# Altium schematic sheet Sheet2.SchDoc
size A4; SheetNumber: 1; SheetTotal: 1
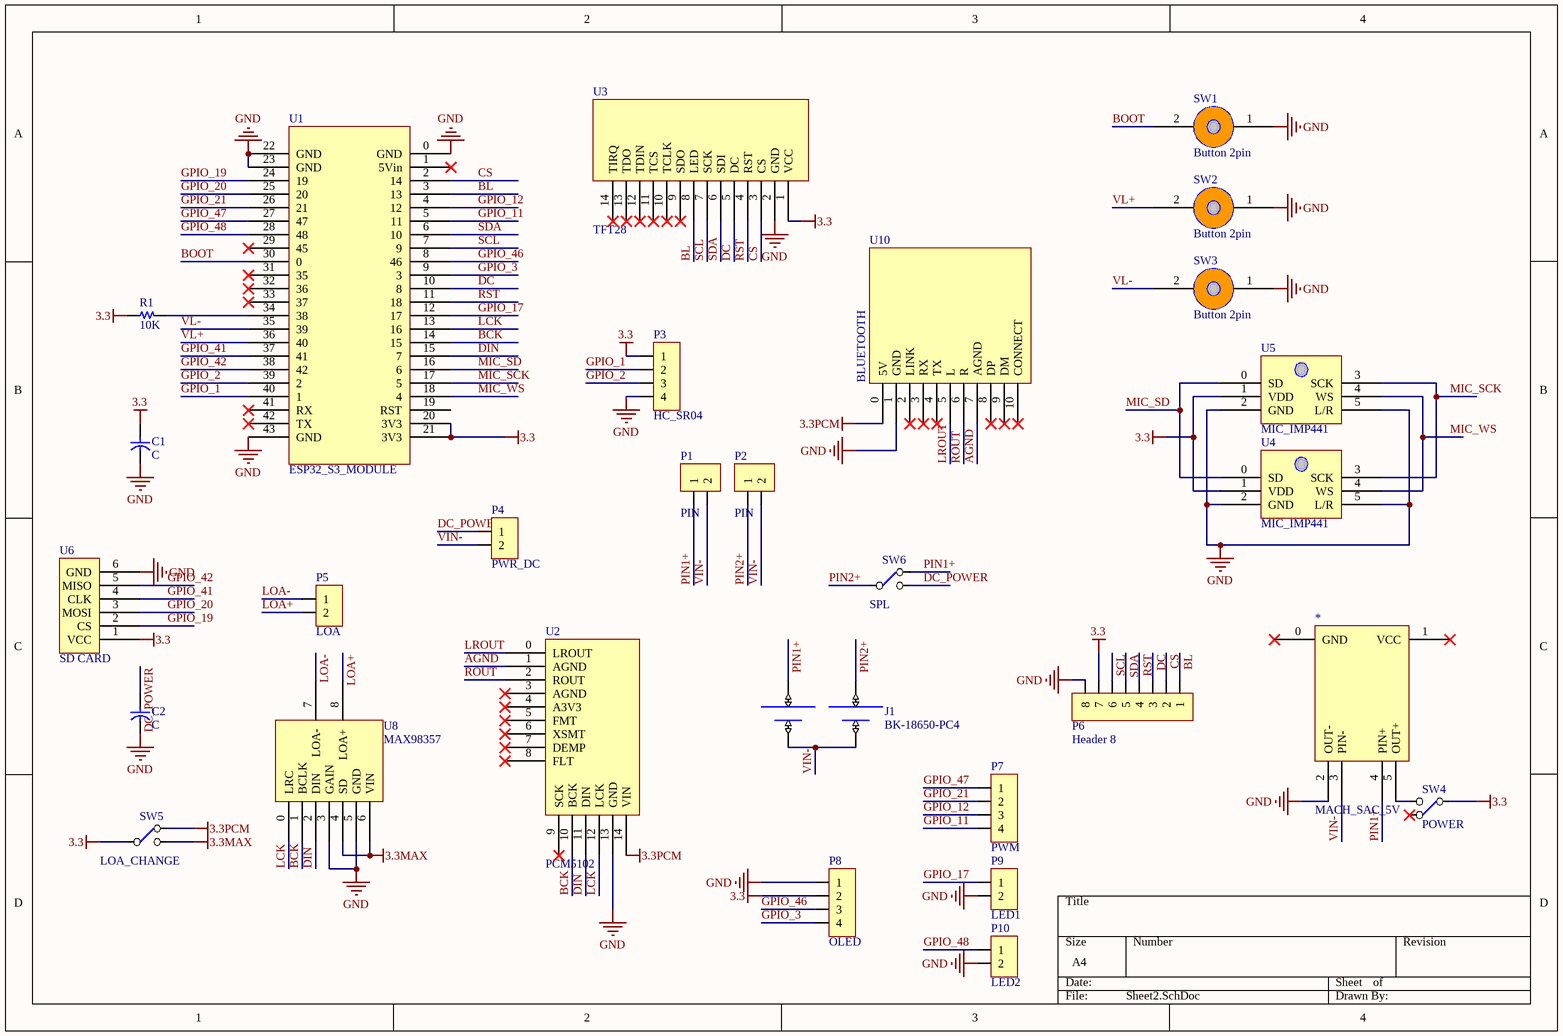
[diagram p0: Sheet2.SchDoc]

## Parts
*  MACH_SAC_5V  [TP4056]
C1  C  [CYL/D.200/LS.75]
C2  C  [CYL/D.200/LS.75]
J1  BK-18650-PC4  [18650-PC4]
P1  PIN  [HDR/Header/2/BOX]
P2  PIN  [HDR/Header/2/BOX]
P3  HC_SR04  [HDR/Header/4/BOX]
P4  PWR_DC  [HDR/Header/2/BOX]
P5  LOA  [HDR/Header/2/BOX]
P6  Header 8  [HDR/Header/8]
P7  PWM  [HDR/Header/4/BOX]
P8  OLED  [HDR/Header/4/BOX]
P9  LED1  [HDR/Header/2/BOX]
P10  LED2  [HDR/Header/2/BOX]
R1  10K  [R 1/4W/300]
SW1  Button 2pin  [Button2Psilicon]
SW2  Button 2pin  [Button2Psilicon]
SW3  Button 2pin  [Button2Psilicon]
SW4  POWER  [SW/3/SPDT/SS12D10]
SW5  LOA_CHANGE  [SW/3/SPDT/SS12D10]
SW6  SPL  [SW/3/SPDT/SS12D10]
U1  ESP32_S3_MODULE  [ESP32_S3_MODULE]
U2  PCM5102  [PCM5102]
U3  TFT28  [TFT - duplicate]
U4  MIC_IMP441  [IMP441]
U5  MIC_IMP441  [IMP441]
U6  SD CARD  [SDCARD_MODULE]
U8  MAX98357  [MAX98357]
U10  BLUETOOTH  [BLE]

## Nets
3.3: C1.1 P3.1 P6.7 P8.2 R1.1 SW4.2(COMMON1) SW5.2(COMMON1) U1.20(3V3) U1.21(3V3) U3.1(VCC) U4.1(VDD) U5.1(VDD) U6.1(VCC)
3.3MAX: SW5.3(NO1) U8.4(SD) U8.6(VIN)
3.3PCM: SW5.1(NC1) U2.14(VIN) U10.0(5V)
GND: *.2(OUT-) C1.2 C2.2 P3.4 P6.8 P8.1 P9.2 P10.2 SW1.1 SW2.1 SW3.1 U1.0(GND) U1.22(GND) U1.23(GND) U1.43(GND) U2.13(GND) U3.2(GND) U4.2(GND) U4.5(L/R) U5.2(GND) U5.5(L/R) U6.6(GND) U8.3(GAIN) U8.5(GND) U10.1(GND)
AGND: U2.1(AGND) U10.7(AGND)
BCK: U1.14(15) U2.10(BCK) U8.1(BCLK)
BL: P6.1 U1.3(13) U3.8(LED)
BOOT: SW1.2 U1.30(0)
CS: P6.2 U1.2(14) U3.3(CS)
DC: P6.3 U1.10(8) U3.5(DC)
DC_POWER: C2.1 P4.1 SW6.3(NO1)
DIN: U1.15(7) U2.11(DIN) U8.2(DIN)
GPIO_1: P3.2 U1.40(1)
GPIO_2: P3.3 U1.39(2)
GPIO_3: P8.4 U1.9(3)
GPIO_11: P7.4 U1.5(11)
GPIO_12: P7.3 U1.4(12)
GPIO_17: P9.1 U1.12(17)
GPIO_19: U1.24(19) U6.2(CS)
GPIO_20: U1.25(20) U6.3(MOSI)
GPIO_21: P7.2 U1.26(21)
GPIO_41: U1.37(41) U6.4(CLK)
GPIO_42: U1.38(42) U6.5(MISO)
GPIO_46: P8.3 U1.8(46)
GPIO_47: P7.1 U1.27(47)
GPIO_48: P10.1 U1.28(48)
LCK: U1.13(16) U2.12(LCK) U8.0(LRC)
LOA+: P5.2 U8.8(LOA+)
LOA-: P5.1 U8.7(LOA-)
LROUT: U2.0(LROUT) U10.5(L)
MIC_SCK: U1.17(5) U4.3(SCK) U5.3(SCK)
MIC_SD: U1.16(6) U4.0(SD) U5.0(SD)
MIC_WS: U1.18(4) U4.4(WS) U5.4(WS)
PIN1+: *.4(PIN+) J1.+1 P1.1 SW6.1(NC1)
PIN2+: J1.+2 P2.1 SW6.2(COMMON1)
ROUT: U2.2(ROUT) U10.6(R)
RST: P6.4 U1.11(18) U3.4(RST)
SCL: P6.6 U1.7(9) U3.7(SCK)
SDA: P6.5 U1.6(10) U3.6(SDI)
VIN-: *.3(PIN-) J1.-1 J1.-2 P1.2 P2.2 P4.2
VL+: SW2.2 U1.36(40)
VL-: SW3.2 U1.35(39)
Net*_5: *.5(OUT+) SW4.3(NO1)
NetR1_2: R1.2 U1.34(38)

Not connected (* = marked no-connect by the designer): * 0(GND)* 1(VCC)*; SW4 1(NC1)*; U1 1(5Vin)* 19(RST) 29(45)* 31(35)* 32(36)* 33(37)* 41(RX)* 42(TX)*; U2 3(AGND)* 4(A3V3)* 5(FMT)* 6(XSMT)* 7(DEMP)* 8(FLT)* 9(SCK)*; U3 9(SDO)* 10(TCLK)* 11(TCS)* 12(TDIN)* 13(TDO)* 14(TIRQ)*; U10 2(LINK)* 3(RX)* 4(TX)* 8(DP)* 9(DM)* 10(CONNECT)*

## Library data of the parts
C1 C2 = Capacitor: Capacitor pol
J1 = BK-18650-PC4: Battery Holder (Open) 18650 2 Cell PC Pin; MF: MPD (Memory Protection Devices); SnapEDA_Link: https://www.snapeda.com/parts/BK-18650-PC4/Memory+Protection+Devices/view-part/?ref=snap; Package: None; Value: *; MP: BK-18650-PC4; Check_prices: https://www.snapeda.com/parts/BK-18650-PC4/Memory+Protection+Devices/view-part/?ref=eda
P1 P2 P4 P5 P9 P10 = Header 2: Header, 2-Pin
P3 P7 P8 = Header 4: Header, 4-Pin
P6 = Header 8: Header, 8-Pin
R1 = Resistor
SW1-SW3 = Silicone 2P button SMD
SW4-SW6 = SW SPDT
U6 = SD Card Module